# Altium project RP2040DualVision.PrjPcb
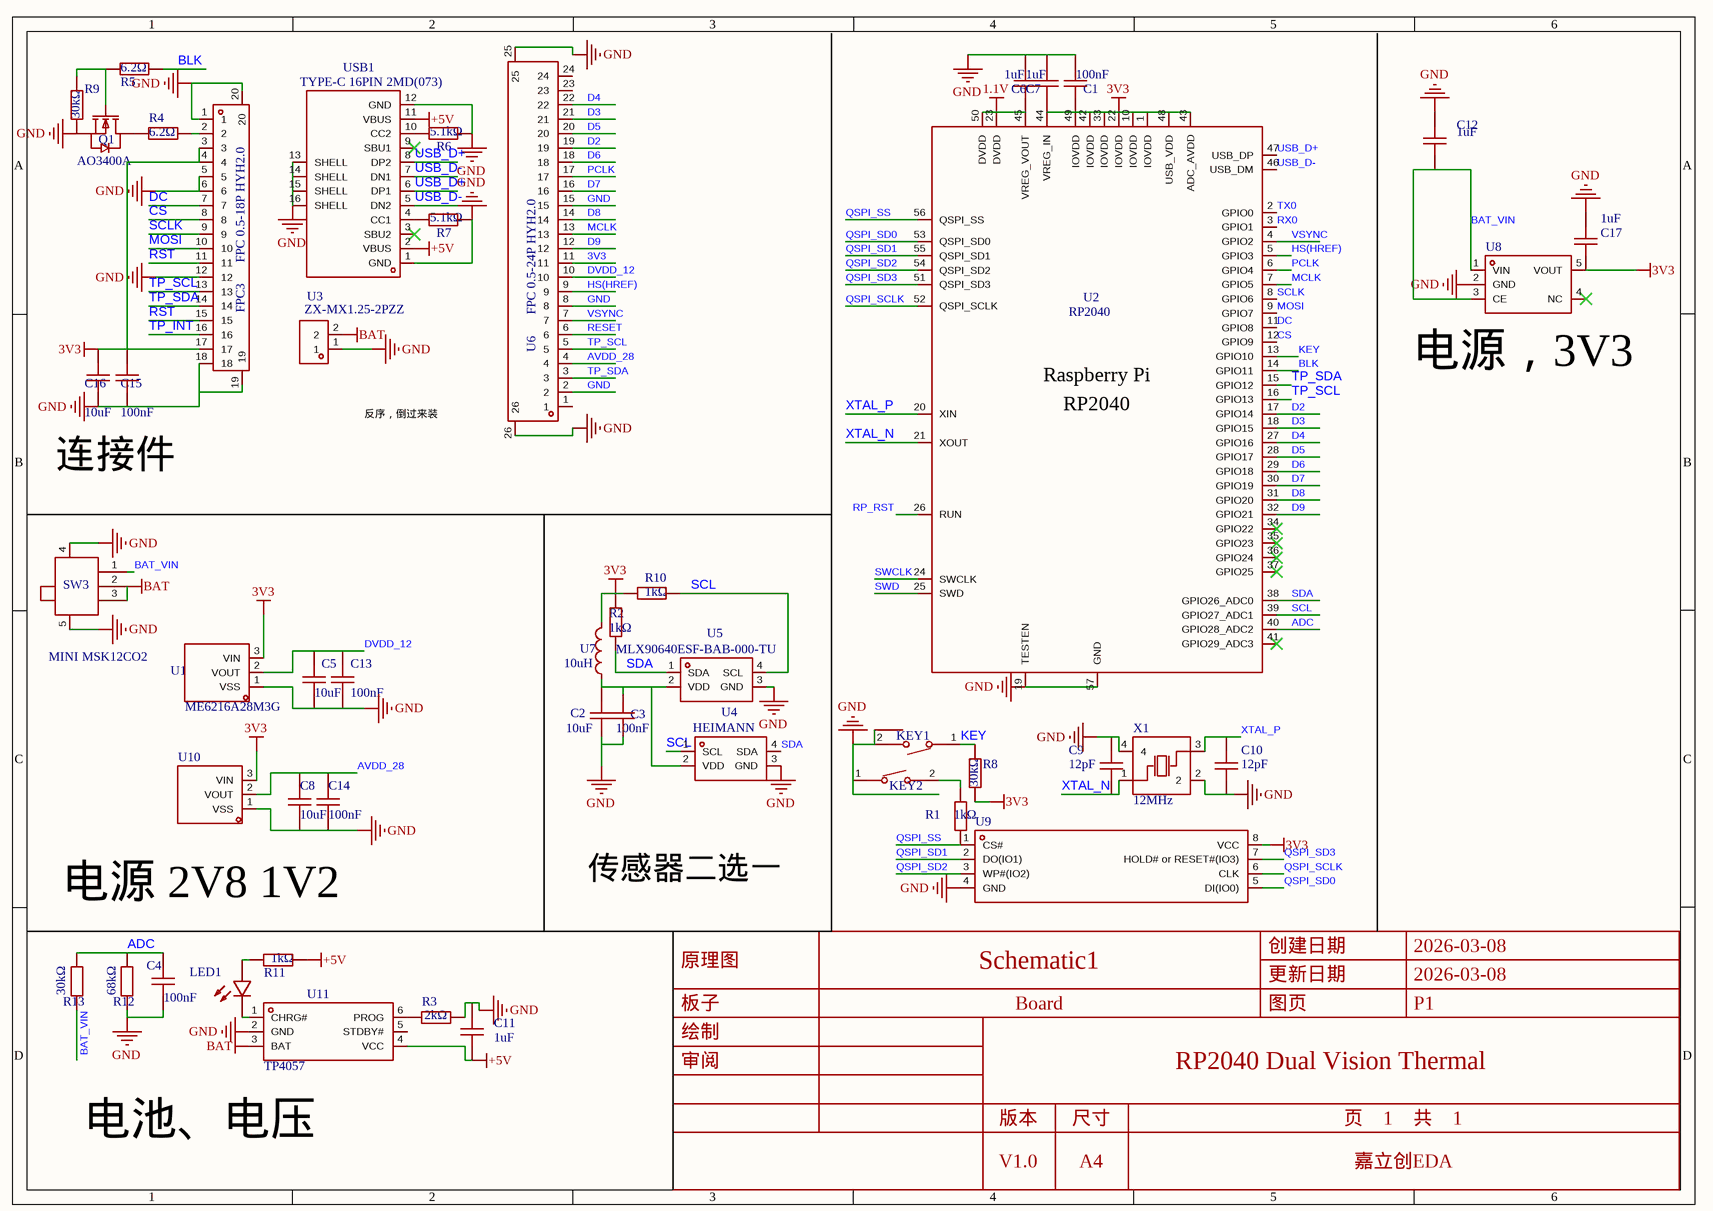
[diagram p0: P1.schdoc]
1 sheet, 49 parts. Net scope: global (net labels, ports and power ports of the same name join across sheets).
Board file: PCB1.pcbdoc

## Sheet P1.schdoc
size 297 x 209 mm; Symbol: Drawing-Symbol_A4; Company: 嘉立创EDA; Version: V1.0; Page Size: A4; @Project Name: RP2040 Dual Vision Thermal; @Page Count: 1; @Update Date: 2026-03-08; @Create Date: 2026-03-08; @Schematic Name: Schematic1; @Page No: 1; @Page Name: P1; @Create Time: 19:50:53; @Update Time: 19:51:13; Border: 1; Width: 1170; Height: 825; Region Start: 1; X Region Count: 6; Y Region Count: 4; Blade Width: 10; Title Block Position: 3; @Board Name: Board; Device: Drawing-Symbol_A4

### Parts
C1  100nF  [C0402]
C2  10uF  [C0402]
C3  100nF  [C0402]
C4  100nF  [C0402]
C5  10uF  [C0402]
C6  1uF  [C0402]
C7  1uF  [C0402]
C8  10uF  [C0402]
C9  12pF  [C0402]
C10  12pF  [C0402]
C11  1uF  [C0603]
C12  1uF  [C0402]
C13  100nF  [C0402]
C14  100nF  [C0402]
C15  100nF  [C0603]
C16  10uF  [C0603]
C17  1uF  [C0402]
FPC3  FPC 0.5-18P HYH2.0  [FPC-SMD_18P-P0.50_FPC-0.5-18P-HYH2.0]
KEY1  1TS003B-2500-3500A-CT  [KEY-SMD_1TS003B-2500-3500A-CT]  (value not drawn)
KEY2  1TS003B-2500-3500A-CT  [KEY-SMD_1TS003B-2500-3500A-CT]  (value not drawn)
LED1  NCD0603G1  [LED0603-RD_1]  (value not drawn)
Q1  AO3400A  [SOT-23-3_L2.9-W1.3-P1.90-LS2.4-BR]
R1  1kΩ  [R0603]
R2  1kΩ  [R0402]
R3  2kΩ  [R0603]
R4  6.2Ω  [R0603]
R5  6.2Ω  [R0603]
R6  5.1kΩ  [R0603]
R7  5.1kΩ  [R0603]
R8  30kΩ  [R0603]
R9  30kΩ  [R0603]
R10  1kΩ  [R0402]
R11  1kΩ  [R0603]
R12  68kΩ  [R0402]
R13  30kΩ  [R0402]
SW3  MINI MSK12CO2  [SW-SMD_MSK12CO2]
U1  ME6216A28M3G  [SOT-23-3_L2.9-W1.3-P1.90-LS2.4-BR]
U2  RP2040  [LQFN-56_L7.0-W7.0-P0.4-EP]
U3  ZX-MX1.25-2PZZ  [CONN-TH_2P-P1.25_MEGASTAR_ZX-MX1.25-2PZZ]
U4  HEIMANN  [TO-39-4_MELEXIS_MLX90640]
U5  MLX90640ESF-BAB-000-TU  [TO-39-4_MELEXIS_MLX90640]
U6  FPC 0.5-24P HYH2.0  [FPC-SMD_24P-P0.50_FPC-0.5-24P-HYH2.0]
U7  10uH  [IND-SMD_L2.0-W1.6-1]
U8  RT9013-33GB-MS  [SOT-23-5_L2.9-W1.6-P0.95-LS2.8-BR]  (value not drawn)
U9  W25Q32JVSSIQ  [SOIC-8_L5.3-W5.3-P1.27-LS8.0-BL]  (value not drawn)
U10  ME6216A12M3G  [SOT-23-3_L2.9-W1.6-P1.90-LS2.8-BR]  (value not drawn)
U11  TP4057  [SOT-23-6_L2.9-W1.6-P0.95-LS2.8-BR]
USB1  TYPE-C 16PIN 2MD(073)  [USB-C-SMD_TYPE-C-6PIN-2MD-073]
X1  12MHz  [OSC-SMD_4P-L2.5-W2.0-BL]

### Nets
1.1V: C6.1 U2.23(DVDD) U2.45(VREG_VOUT) U2.50(DVDD)
3V3: C1.1 C7.1 C15.2 C16.1 C17.1 FPC3.3 FPC3.4 FPC3.17 R2.2 R8.1 R10.2 U1.3(VIN) U2.1(IOVDD) U2.10(IOVDD) U2.22(IOVDD) U2.33(IOVDD) U2.42(IOVDD) U2.43(ADC_AVDD) U2.44(VREG_IN) U2.48(USB_VDD) U2.49(IOVDD) U6.11 U7.2 U8.5(VOUT) U9.8(VCC) U10.3(VIN)
+5V: C11.1 R11.1 U11.4(VCC) USB1.2(VBUS) USB1.11(VBUS)
BAT: SW3.2 SW3.3 U3.2 U11.3(BAT)
GND: C1.2 C2.1 C3.1 C4.1 C5.2 C6.2 C7.2 C8.2 C9.1 C10.2 C11.2 C12.2 C13.2 C14.2 C15.1 C16.2 C17.2 FPC3.1 FPC3.5 FPC3.6 FPC3.12 FPC3.18 FPC3.19 FPC3.20 KEY1.0 KEY1.2 KEY2.0 KEY2.1 Q1.2(S) R3.1 R6.1 R7.2 R9.2 R12.1 SW3.4 SW3.5 U1.1(VSS) U2.19(TESTEN) U2.57(GND) U3.1 U4.3(GND) U5.3(GND) U6.2 U6.8 U6.15 U6.25 U6.26 U8.2(GND) U9.4(GND) U10.1(VSS) U11.2(GND) USB1.1(GND) USB1.12(GND) USB1.13(SHELL) USB1.14(SHELL) USB1.15(SHELL) USB1.16(SHELL) X1.2 X1.4
ADC: C4.2 R12.2 R13.2 U2.40(GPIO28_ADC2)
AVDD_28: C8.1 C14.1 U6.4 U10.2(VOUT)
BAT_VIN: C12.1 R13.1 SW3.1 U8.1(VIN) U8.3(CE)
BLK: R5.2 U2.14(GPIO11)
CS: FPC3.8 U2.12(GPIO9)
D2: U2.17(GPIO14) U6.19
D3: U2.18(GPIO15) U6.21
D4: U2.27(GPIO16) U6.22
D5: U2.28(GPIO17) U6.20
D6: U2.29(GPIO18) U6.18
D7: U2.30(GPIO19) U6.16
D8: U2.31(GPIO20) U6.14
D9: U2.32(GPIO21) U6.12
DC: FPC3.7 U2.11(GPIO8)
DVDD_12: C5.1 C13.1 U1.2(VOUT) U6.10
HS(HREF): U2.5(GPIO3) U6.9
KEY: KEY1.1 R8.2 U2.13(GPIO10)
MCLK: U2.7(GPIO5) U6.13
MOSI: FPC3.10 U2.9(GPIO7)
PCLK: U2.6(GPIO4) U6.17
QSPI_SCLK: U2.52(QSPI_SCLK) U9.6(CLK)
QSPI_SD0: U2.53(QSPI_SD0) U9.5(DI(IO0))
QSPI_SD1: U2.55(QSPI_SD1) U9.2(DO(IO1))
QSPI_SD2: U2.54(QSPI_SD2) U9.3(WP#(IO2))
QSPI_SD3: U2.51(QSPI_SD3) U9.7(HOLD#_or_RESET#(IO3))
QSPI_SS: R1.1 U2.56(QSPI_SS) U9.1(CS#)
RESET: U6.6
RP_RST: U2.26(RUN)
RST: FPC3.11 FPC3.15
RX0: U2.3(GPIO1)
SCL: R10.1 U2.39(GPIO27_ADC1) U4.1(SCL) U5.4(SCL)
SCLK: FPC3.9 U2.8(GPIO6)
SDA: R2.1 U2.38(GPIO26_ADC0) U4.4(SDA) U5.1(SDA)
SWCLK: U2.24(SWCLK)
SWD: U2.25(SWD)
TP_INT: FPC3.16
TP_SCL: FPC3.13 U2.16(GPIO13) U6.5
TP_SDA: FPC3.14 U2.15(GPIO12) U6.3
TX0: U2.2(GPIO0)
USB_D+: U2.47(USB_DP) USB1.6(DP1) USB1.8(DP2)
USB_D-: U2.46(USB_DM) USB1.5(DN2) USB1.7(DN1)
VSYNC: U2.4(GPIO2) U6.7
XTAL_N: C9.2 U2.21(XOUT) X1.1(OSC1)
XTAL_P: C10.1 U2.20(XIN) X1.3(OSC2)
NetC2_2: C2.2 C3.2 U4.2(VDD) U5.2(VDD) U7.1
NetFPC3_2: FPC3.2 R4.1
NetKEY2_2: KEY2.2 R1.2
NetLED1_1: LED1.1(K) U11.1(CHRG#)
NetLED1_2: LED1.2(A) R11.2
NetQ1_1: Q1.1(G) R5.1 R9.1
NetQ1_3: Q1.3(D) R4.2
NetR3_2: R3.2 U11.6(PROG)
NetR6_2: R6.2 USB1.10(CC2)
NetR7_1: R7.1 USB1.4(CC1)

Not connected (* = marked no-connect by the designer): U2 34(GPIO22)* 35(GPIO23)* 36(GPIO24)* 37(GPIO25)* 41(GPIO29_ADC3)*; U6 1 23 24; U8 4(NC)*; U11 5(STDBY#); USB1 3(SBU2)* 9(SBU1)*

### Notes on the sheet
- (near U8) 电源，3V3
- 反序，倒过来装
- 连接件
- 电源 2V8 1V2
- 传感器二选一
- 电池、电压
- 创建日期
- 2026-03-08
- 原理图
- 板子
- Schematic1
- Board
- 更新日期
- 图页
- P1
- 绘制
- 审阅
- RP2040 Dual Vision Thermal
- 版本
- V1.0
- 尺寸
- A4
- 页    1    共    1
- 嘉立创EDA
- (in symbol RP2040_C2040) Raspberry Pi

### Library data of the parts
C1 C3 C4 C14 C15 = CGA0603X7R104K500JT: 容值:100nF;精度:±10%;额定电压:50V;温度系数:X7R;; Manufacturer: HRE(芯声); Convert to PCB: yes; ModelId: ac125912035d415993ca9572d50418b1; ModelName: C0603_L1.6-W0.8-H0.8; ModelTransform: 62.992,31.496,0,0,0,0,0,0,0; Tolerance: ±10%; Voltage Rating: 50V; Temperature Coefficient: X7R; Device: CGA0603X7R104K500JT; Symbol: CGA0603X7R104K500JT; Supplier Part: C6119867; Supplier: LCSC; Manufacturer Part: CGA0603X7R104K500JT; Add into BOM: yes; LCSC Part Name: 100nF ±10% 50V; Supplier Footprint: 0603; JLCPCB Part Class: Extended Part; Datasheet: https://atta.szlcsc.com/upload/public/pdf/source/20250103/C44077DA9E7B3EFAE02F22B6D3D1CBC9.pdf; Value: 100nF
  C1 C3 C4 C14: FootprintName: C0402
  C15: FootprintName: C0603
C2 C8 C16 = CGA0603X5R106K100JT: 容值:10uF;精度:±10%;额定电压:10V;温度系数:X5R;; Manufacturer: HRE(芯声); Convert to PCB: yes; ModelId: ac125912035d415993ca9572d50418b1; ModelName: C0603_L1.6-W0.8-H0.8; ModelTransform: 62.992,31.496,0,0,0,0,0,0,0; Tolerance: ±10%; Voltage Rating: 10V; Temperature Coefficient: X5R; Device: CGA0603X5R106K100JT; Symbol: CGA0603X5R106K100JT; Supplier: LCSC; Supplier Part: C6119842; Manufacturer Part: CGA0603X5R106K100JT; Add into BOM: yes; LCSC Part Name: 10uF ±10% 10V; Supplier Footprint: 0603; JLCPCB Part Class: Extended Part; Value: 10uF
  C2 C8: FootprintName: C0402
  C16: FootprintName: C0603
C5 = CGA0603X5R106K100JT: 容值:10uF;精度:±10%;额定电压:10V;温度系数:X5R;; Manufacturer: HRE(芯声); Convert to PCB: yes; 3D Model: ac125912035d415993ca9572d50418b1; 3D Model Transform: 62.992,31.496,0,0,0,0,0,0,0; Tolerance: ±10%; Voltage Rating: 10V; Temperature Coefficient: X5R; ModelName: C0603_L1.6-W0.8-H0.8; Device: CGA0603X5R106K100JT; Symbol: CGA0603X5R106K100JT; Supplier: LCSC; Supplier Part: C6119842; Manufacturer Part: CGA0603X5R106K100JT; Add into BOM: yes; LCSC Part Name: 10uF ±10% 10V; Supplier Footprint: 0603; JLCPCB Part Class: Extended Part; Value: 10uF; FootprintName: C0402
C6 C7 C11 = CGA0603X5R105K500JT: 容值:1uF;精度:±10%;额定电压:50V;温度系数:X5R;; Manufacturer: HRE(芯声); Convert to PCB: yes; ModelId: ac125912035d415993ca9572d50418b1; ModelName: C0603_L1.6-W0.8-H0.8; ModelTransform: 62.992,31.496,0,0,0,0,0,0,0; Tolerance: ±10%; Voltage Rating: 50V; Temperature Coefficient: X5R; Device: CGA0603X5R105K500JT; Symbol: CGA0603X5R105K500JT; Supplier Part: C6119852; Supplier: LCSC; Manufacturer Part: CGA0603X5R105K500JT; Add into BOM: yes; LCSC Part Name: 1uF ±10% 50V; Supplier Footprint: 0603; JLCPCB Part Class: Extended Part; Value: 1uF
  C6 C7: FootprintName: C0402
  C11: FootprintName: C0603
C9 C10 = 0603CG120F500NT: 容值:12pF;精度:±1%;额定电压:50V;材质(温度系数):C0G;; Manufacturer: FH(风华); Convert to PCB: yes; ModelId: ac125912035d415993ca9572d50418b1; ModelName: C0603_L1.6-W0.8-H0.8; ModelTransform: 62.992,31.496,0,0,0,0,0,0,0; Tolerance: ±1%; Voltage Rated: 50V; Temperature Coefficient: C0G; Device: 0603CG120F500NT; Symbol: 0603CG120F500NT; Supplier: LCSC; Supplier Part: C182482; Manufacturer Part: 0603CG120F500NT; Add into BOM: yes; LCSC Part Name: 12pF ±1% 50V; Supplier Footprint: 0603; JLCPCB Part Class: Extended Part; Datasheet: https://atta.szlcsc.com/upload/public/pdf/source/20200305/C486355_26A10D38EF8C2A5C37091D0039909270.pdf; FootprintName: C0402; Value: 12pF
C12 C17 = CGA0603X5R105K500JT: 容值:1uF;精度:±10%;额定电压:50V;温度系数:X5R;; Manufacturer: HRE(芯声); Add into BOM: yes; 3D Model: ac125912035d415993ca9572d50418b1; 3D Model Transform: 62.992,31.496,0,0,0,0,0,0,0; Tolerance: ±10%; Voltage Rating: 50V; Temperature Coefficient: X5R; ModelName: C0603_L1.6-W0.8-H0.8; Symbol: CGA0603X5R105K500JT; Device: CGA0603X5R105K500JT; Convert to PCB: yes; Supplier Part: C6119852; Supplier: LCSC; Manufacturer Part: CGA0603X5R105K500JT; LCSC Part Name: 1uF ±10% 50V; Supplier Footprint: 0603; JLCPCB Part Class: Extended Part; Value: 1uF; FootprintName: C0402
C13 = CGA0603X7R104K500JT: 容值:100nF;精度:±10%;额定电压:50V;温度系数:X7R;; Manufacturer: HRE(芯声); Convert to PCB: yes; 3D Model: ac125912035d415993ca9572d50418b1; 3D Model Transform: 62.992,31.496,0,0,0,0,0,0,0; Tolerance: ±10%; Voltage Rating: 50V; Temperature Coefficient: X7R; ModelName: C0603_L1.6-W0.8-H0.8; Device: CGA0603X7R104K500JT; Symbol: CGA0603X7R104K500JT; Supplier: LCSC; Supplier Part: C6119867; Manufacturer Part: CGA0603X7R104K500JT; Add into BOM: yes; LCSC Part Name: 100nF ±10% 50V; Supplier Footprint: 0603; JLCPCB Part Class: Extended Part; Datasheet: https://atta.szlcsc.com/upload/public/pdf/source/20250103/C44077DA9E7B3EFAE02F22B6D3D1CBC9.pdf; Value: 100nF; FootprintName: C0402
FPC3 = FPC 0.5-18P HYH2.0: 锁定特性:翻盖式;触点类型:双侧触点/上下接;触点数量:18P;间距:0.5mm;安装类型:卧贴;工作温度范围:-25℃~+85℃;; Manufacturer: SHOU HAN(首韩); Symbol: 0.5K-HX-18PWB; Convert to PCB: yes; ModelId: c307a3740b784ab2974115b74c22844b; ModelTransform: 482.676,212.598,0,0,0,0,0,-33.465,0; Locking Feature: 翻盖式; Number of Contacts: 18P; Pitch: 0.5mm; Device: FPC 0.5-18P HYH2.0; Supplier: LCSC; Supplier Part: C6364663; Manufacturer Part: FPC 0.5-18P HYH2.0; Add into BOM: yes; LCSC Part Name: 翻盖式 双侧触点/上下接 P数:18P 间距:0.5mm; Supplier Footprint: SMD,P=0.5mm,卧贴; JLCPCB Part Class: Extended Part; Datasheet: https://atta.szlcsc.com/upload/public/pdf/source/20230523/62F572C84183A3F56D4E397A51200C96.pdf; FootprintName: FPC-SMD_18P-P0.50_FPC-0.5-18P-HYH2.0; ModelName: FPC-SMD_18P-P0.50_FPC-0.5-18P-HYH2.0; Contact Type: 双侧触点/上下接; Mounting Type: 卧贴; Height Above Board: 2mm; Contact Material: 铜; Contact Plating: 锡; Operating Temperature Range: -25℃~+85℃
KEY1 KEY2 = 1TS003B-2500-3500A-CT: 电路结构:单刀单掷;按钮形状:矩形按钮;作用力:250gf;安装方式:卧贴;开关长度:4.6mm;开关宽度:1.82mm;开关高度:3.5mm;带支架:不带;触点电流:50mA;额定电压(DC):12V;额定功率:0.6W;绝缘电阻:100MΩ;带灯:无;机械寿命:1.5万次;; Manufacturer: HYP(鸿源精密); Convert to PCB: yes; ModelId: d59c0297adac4306a1d4ba4f2a7de8bf; ModelName: KEY-SMD_L4.6-W2.3-H1.8-P3.4; ModelTransform: 181.102,139.7635,0,0,0,0,-0.005,-28.621,-19.685; Circuit: 单刀单掷; Actuator Style: 矩形按钮; Operating Force: 250gf; Switch Length: 4.6mm; Switch Width: 1.82mm; Switch Height: 3.5mm; Strike Gundam: 不带; Contact Current: 50mA; Voltage Rating (DC): 12V; Power Rating: 0.6W; Insulation Resistance: 100MΩ; Actuator/Cap Color: 黑色; With Lamp: 无; Pin Style: J型引脚; Mechanical Life: 1.5万次; Device: 1TS003B-2500-3500A-CT; Symbol: 1TS003B-2500-3500A; Supplier: LCSC; Supplier Part: C255810; Manufacturer Part: 1TS003B-2500-3500A-CT; Add into BOM: yes; LCSC Part Name: 4.6*1.82*3.5mm 卧贴 轻触开关; Supplier Footprint: SMD,2x4mm; JLCPCB Part Class: Extended Part; Datasheet: https://atta.szlcsc.com/upload/public/pdf/source/20180720/C255810_F77B30B42331AEA91D48A1AA0FBA2945.pdf; FootprintName: KEY-SMD_1TS003B-2500-3500A-CT; Mounting Style: 卧贴; Operating Temperature: -40℃~+90℃
LED1 = NCD0603G1: 发光颜色:翠绿色;正向压降(Vf):2.6V~3.6V;功率:72mW;正向电流:20mA;波长:515nm~530nm;透镜颜色:-;发光强度:330mcd~900mcd;发光角度:130°;工作温度:-30℃~+85℃;; Manufacturer: 国星光电; Symbol: FC-D1608UGK-520D10; Convert to PCB: yes; ModelId: 3beb0148d24d477aac1d9f7d4b6d534c; ModelTransform: 62.2046,31.496,0,0,0,0,-1.948,0.215,0; Illumination Color: 翠绿色; Power(Watts): 72mW; Forward Current: 20mA; Viewing Angle: 130°; Device: NCD0603G1; Supplier: LCSC; Manufacturer Part: NCD0603G1; Supplier Part: C84267; Add into BOM: yes; LCSC Part Name: NCD0603G1; Supplier Footprint: 0603; JLCPCB Part Class: Extended Part; Datasheet: https://item.szlcsc.com/datasheet/NCD0603G1/85436.html; FootprintName: LED0603-RD_1; ModelName: LED0603-RD_1; Voltage - Forward(Vf): 2.6V~3.6V; Wavelength - Dominant: 515nm~530nm; Lens Color: -; Luminous Intensity: 330mcd~900mcd; Operating Temperature: -30℃~+85℃
Q1 = AO3400A_C347475: 类型:1个N沟道;漏源电压(Vdss):30V;连续漏极电流(Id):5.8A;导通电阻(RDS(on)@Vgs,Id):28mΩ@10V,5.8A;功率(Pd):1.4W;阈值电压(Vgs(th)@Id):1.4V@250uA;; Manufacturer: UMW(友台半导体); Convert to PCB: yes; ModelId: c62791f0466c4ae2a892c056b845b0ca; ModelName: SOT-23-3P_L2.9-W1.3-H1.0-LS2.4-P0.95; ModelTransform: 98.425,114.173,0,180,0,0,0.0005,-0.0005,0; Type: 1个N沟道; Drain Source Voltage (Vdss): 30V; Power Dissipation (Pd): 1.4W; Total Gate Charge (Qg@Vgs): 12nC@10V; Input Capacitance (Ciss@Vds): 1.05nF@24V; Reverse Transfer Capacitance (Crss@Vds): 77pF@15V; Device: AO3400A_C347475; Symbol: AO3400A_C347475; Supplier: LCSC; Supplier Part: C347475; Manufacturer Part: AO3400A; JLCPCB Part Class: Extended Part; Add into BOM: yes; LCSC Part Name: 1个N沟道 耐压:30V 电流:5.8A; Supplier Footprint: SOT-23; Datasheet: https://atta.szlcsc.com/upload/public/pdf/source/20231109/50AB4FB4D66E55864F9B8D027B723C9A.pdf; FootprintName: SOT-23-3_L2.9-W1.3-P1.90-LS2.4-BR; Continuous Drain Current (Id): 5.8A; Drain Source On Resistance (RDS(on)@Vgs,Id): 28mΩ@10V,5.8A; Gate Threshold Voltage (Vgs(th)@Id): 1.4V@250uA; Operating Temperature: -55℃~+150℃
R1 R11 = 0603WAF1001T5E: 电阻类型:厚膜电阻;阻值:1kΩ;精度:±1%;功率:100mW;最大工作电压:75V;温度系数:±100ppm/℃;; Manufacturer: UNI-ROYAL(厚声); Convert to PCB: yes; ModelId: fc143cca1e79419f9cd78b61e9279f08; ModelTransform: 31.8897,63.7794,0,90,0,0,0,0,0; Tolerance: ±1%; Power(Watts): 100mW; Overload Voltage (Max): 75V; Device: 0603WAF1001T5E; Symbol: 0603WAF1001T5E; Supplier Part: C21190; Supplier: LCSC; Manufacturer Part: 0603WAF1001T5E; Add into BOM: yes; LCSC Part Name: 1kΩ ±1% 100mW 厚膜电阻; Supplier Footprint: 0603; JLCPCB Part Class: 基础库; Datasheet: https://atta.szlcsc.com/upload/public/pdf/source/20200306/C422600_1E6D84923E4A46A82E41ADD87F860B5C.pdf; FootprintName: R0603; ModelName: R0603; Type: 厚膜电阻; Value: 1kΩ; Temperature Coefficient: ±100ppm/℃; Operating Temperature Range: -55℃~+155℃
R2 R10 = 0603WAF1001T5E: 电阻类型:厚膜电阻;阻值:1kΩ;精度:±1%;功率:100mW;最大工作电压:75V;温度系数:±100ppm/℃;; Manufacturer: UNI-ROYAL(厚声); Convert to PCB: yes; ModelId: fc143cca1e79419f9cd78b61e9279f08; ModelName: R0603; ModelTransform: 31.8897,63.7794,0,90,0,0,0,0,0; Tolerance: ±1%; Power(Watts): 100mW; Overload Voltage (Max): 75V; Device: 0603WAF1001T5E; Symbol: 0603WAF1001T5E; Supplier: LCSC; Supplier Part: C21190; Manufacturer Part: 0603WAF1001T5E; Add into BOM: yes; LCSC Part Name: 1kΩ ±1% 100mW 厚膜电阻; Supplier Footprint: 0603; JLCPCB Part Class: 基础库; Datasheet: https://atta.szlcsc.com/upload/public/pdf/source/20200306/C422600_1E6D84923E4A46A82E41ADD87F860B5C.pdf; FootprintName: R0402; Type: 厚膜电阻; Value: 1kΩ; Temperature Coefficient: ±100ppm/℃; Operating Temperature Range: -55℃~+155℃
R3 = 0603WAF2001T5E: 电阻类型:厚膜电阻;阻值:2kΩ;精度:±1%;功率:100mW;工作电压:75V;温度系数:±100ppm/℃;; Manufacturer: UNI-ROYAL(厚声); nameAlias: Resistance (Ohms); Contributor: dhx233; Convert to PCB: yes; ModelId: fc143cca1e79419f9cd78b61e9279f08; ModelTransform: 31.8897,63.7794,0,90,0,0,0,0,0; Tolerance: ±1%; Power(Watts): 100mW; Voltage-Supply(Max): 75V; Origin Footprint: R0603; Device: 0603WAF2001T5E; Symbol: 0603WAF2001T5E; Supplier: LCSC; Supplier Part: C22975; Manufacturer Part: 0603WAF2001T5E; spicePre: R; spiceSymbolName: res-0603; Add into BOM: yes; LCSC Part Name: 2kΩ ±1% 100mW 厚膜电阻; Supplier Footprint: 0603; JLCPCB Part Class: Basic Part; Datasheet: https://atta.szlcsc.com/upload/public/pdf/source/20200306/C422600_1E6D84923E4A46A82E41ADD87F860B5C.pdf; FootprintName: R0603; ModelName: R0603; Type: 厚膜电阻; Value: 2kΩ; Temperature Coefficient: ±100ppm/℃; Operating Temperature: -55℃~+155℃
R4 R5 = 0603WAF6201T5E: 电阻类型:厚膜电阻;阻值:6.2kΩ;精度:±1%;功率:100mW;工作电压:75V;温度系数:±100ppm/℃;; Manufacturer: UNI-ROYAL(厚声); Convert to PCB: yes; ModelId: fc143cca1e79419f9cd78b61e9279f08; ModelTransform: 31.8897,63.7794,0,90,0,0,0,0,0; Tolerance: ±1%; Power(Watts): 100mW; Voltage-Supply(Max): 75V; Value: 6.2Ω; Device: 0603WAF6201T5E; Symbol: 0603WAF6201T5E; Supplier: LCSC; Manufacturer Part: 0603WAF6201T5E; Add into BOM: yes; LCSC Part Name: 6.2kΩ ±1% 100mW 厚膜电阻; Supplier Footprint: 0603; JLCPCB Part Class: Basic Part; Datasheet: https://item.szlcsc.com/datasheet/0603WAF6201T5E/4667.html; FootprintName: R0603; ModelName: R0603; Type: 厚膜电阻; Temperature Coefficient: ±100ppm/℃; Operating Temperature: -55℃~+155℃
R6 R7 = 0603WAF5101T5E: 电阻类型:厚膜电阻;阻值:5.1kΩ;精度:±1%;功率:100mW;工作电压:75V;温度系数:±100ppm/℃;; Manufacturer: UNI-ROYAL(厚声); Convert to PCB: yes; ModelId: fc143cca1e79419f9cd78b61e9279f08; ModelTransform: 31.8897,63.7794,0,90,0,0,0,0,0; Tolerance: ±1%; Power(Watts): 100mW; Voltage-Supply(Max): 75V; Device: 0603WAF5101T5E; Symbol: 0603WAF5101T5E; Supplier: LCSC; Supplier Part: C23186; Manufacturer Part: 0603WAF5101T5E; Add into BOM: yes; LCSC Part Name: 5.1kΩ ±1% 100mW 厚膜电阻; Supplier Footprint: 0603; JLCPCB Part Class: Basic Part; Datasheet: https://atta.szlcsc.com/upload/public/pdf/source/20200306/C422600_1E6D84923E4A46A82E41ADD87F860B5C.pdf; FootprintName: R0603; ModelName: R0603; Type: 厚膜电阻; Value: 5.1kΩ; Temperature Coefficient: ±100ppm/℃; Operating Temperature: -55℃~+155℃
R8 R9 = 0603WAF3002T5E: 电阻类型:厚膜电阻;阻值:30kΩ;精度:±1%;功率:100mW;最大工作电压:75V;温度系数:±100ppm/℃;; Manufacturer: UNI-ROYAL(厚声); Convert to PCB: yes; ModelId: fc143cca1e79419f9cd78b61e9279f08; ModelTransform: 31.8897,63.7794,0,90,0,0,0,0,0; Tolerance: ±1%; Power(Watts): 100mW; Overload Voltage (Max): 75V; Device: 0603WAF3002T5E; Symbol: 0603WAF3002T5E; Supplier: LCSC; Supplier Part: C22984; Manufacturer Part: 0603WAF3002T5E; Add into BOM: yes; LCSC Part Name: 30kΩ ±1% 100mW 厚膜电阻; Supplier Footprint: 0603; JLCPCB Part Class: Basic Part; Datasheet: https://atta.szlcsc.com/upload/public/pdf/source/20200306/C422600_1E6D84923E4A46A82E41ADD87F860B5C.pdf; FootprintName: R0603; ModelName: R0603; Type: 厚膜电阻; Value: 30kΩ; Temperature Coefficient: ±100ppm/℃; Operating Temperature Range: -55℃~+155℃
R12 = 0603WAF6802T5E: 电阻类型:厚膜电阻;阻值:68kΩ;精度:±1%;功率:100mW;工作电压:75V;温度系数:±100ppm/℃;; Manufacturer: UNI-ROYAL(厚声); Symbol: 0603WAF6803T5E; Convert to PCB: yes; ModelId: fc143cca1e79419f9cd78b61e9279f08; ModelName: R0603; ModelTransform: 31.8897,63.7794,0,90,0,0,0,0,0; Tolerance: ±1%; Power(Watts): 100mW; Voltage-Supply(Max): 75V; Device: 0603WAF6802T5E; Supplier: LCSC; Supplier Part: C23231; Manufacturer Part: 0603WAF6802T5E; Add into BOM: yes; LCSC Part Name: 68kΩ ±1% 100mW 厚膜电阻; Supplier Footprint: 0603; JLCPCB Part Class: Basic Part; Datasheet: https://item.szlcsc.com/datasheet/0603WAF6802T5E/23958.html; FootprintName: R0402; Type: 厚膜电阻; Value: 68kΩ; Temperature Coefficient: ±100ppm/℃; Operating Temperature: -55℃~+155℃
R13 = 0603WAF3002T5E: 电阻类型:厚膜电阻;阻值:30kΩ;精度:±1%;功率:100mW;工作电压:75V;温度系数:±100ppm/℃;; Manufacturer: UNI-ROYAL(厚声); Symbol: 0603WAF3003T5E; Convert to PCB: yes; Voltage-Supply(Max): 75V; ModelId: fc143cca1e79419f9cd78b61e9279f08; ModelName: R0603; ModelTransform: 31.8897,63.7794,0,90,0,0,0,0,0; Tolerance: ±1%; Power(Watts): 100mW; Datasheet: https://item.szlcsc.com/datasheet/0603WAF3002T5E/23711.html; Device: 0603WAF3002T5E; Supplier: LCSC; Supplier Part: C22984; Manufacturer Part: 0603WAF3002T5E; Add into BOM: yes; Operating Temperature: -55℃~+155℃; LCSC Part Name: 30kΩ ±1% 100mW 厚膜电阻; Supplier Footprint: 0603; JLCPCB Part Class: Basic Part; FootprintName: R0402; Type: 厚膜电阻; Value: 30kΩ; Overload Voltage (Max): 75V; Temperature Coefficient: ±100ppm/℃; Operating Temperature Range: -55℃~+155℃
SW3 = MINI MSK12CO2: 电路结构:单刀双掷;安装方式:卧贴;开关颜色:-;额定电流(DC):50mA;额定电压(DC):12V;额定电流(AC):-;额定电压(AC):-;机械寿命:1万次;; Manufacturer: SHOU HAN(首韩); Convert to PCB: yes; ModelId: 117ad1edd5404399859fbaa8e94e3fc9; ModelTransform: 236.22,202.7555,0,0,0,0,0,-24.921,-19.685; Circuit: 单刀双掷; Pin Style: SMD接片; Switch Length: 5mm; Switch Width: 2.75mm; Switch Height: 1.4mm; Current Rating (DC): 50mA; Voltage Rating (DC): 12V; Mechanical Life: 1万次; Device: MINI MSK12CO2; Symbol: MINI MSK12CO2; Supplier: LCSC; Supplier Part: C2681570; Manufacturer Part: MINI MSK12CO2; JLCPCB Part Class: Extended Part; Add into BOM: yes; LCSC Part Name: 迷你七脚两档侧拨拨动 mini七7脚 微型拨动; Supplier Footprint: SMD; Datasheet: https://atta.szlcsc.com/upload/public/pdf/source/20210224/C2681570_D263F9C605E4588A4AE6114B72AE4C72.pdf; FootprintName: SW-SMD_MSK12CO2; ModelName: SW-SMD_MSK12CO2; Actuator Style: -; Mounting Style: 卧贴; Actuator Color: -; Current Rating (AC): -; Voltage Rating (AC): -; Operating Temperature: -16℃~+60℃
U1 = ME6216A28M3G: 输出类型:固定;工作电压:9V;输出电压:2.8V;输出电流:300mA;电源纹波抑制比(PSRR):65dB@(1kHz);输出极性:正极;; Manufacturer: MICRONE(南京微盟); AddInBom: yes; ModelId: c62791f0466c4ae2a892c056b845b0ca|0819f05c4eef4c71ace90d822a990e87; ModelName: SOT-23-3P_L2.9-W1.3-H1.0-LS2.4-P0.95; ModelTransform: 98.425,114.173,0,180,0,0,0.0005,-0.0005,0; Output Type: 固定; Voltage - Supply: 9V; Output Voltage: 2.8V; Output Current: 300mA; Voltage Dropout: 120mV@(100mA)；230mV@(200mA); standby current: 5uA; Output Configuration: 正极; Number of Outputs: 1; Symbol: ME6216A28M3G; Device: ME6216A28M3G; LCSC Part Name: 2.8V 300mA 9V; SupplierPart: C236658; ManufacturerPart: ME6216A28M3G; Supplier Footprint: SOT-23-3; JLCPCB Part Class: Extended Part; Datasheet: https://item.szlcsc.com/datasheet/ME6216A28M3G/236098.html; Supplier: LCSC; ConvertToPcb: yes; FootprintName: SOT-23-3_L2.9-W1.3-P1.90-LS2.4-BR; Power Supply Rejection Ratio (PSRR): 65dB@(1kHz); Features: 短路保护；过流保护; Operating Temperature: -25℃~+125℃@(Ta)
U2 = RP2040_C2040: CPU内核:-;CPU最大主频:133MHz;应用领域:-;; Manufacturer: Raspberry Pi(树莓派); Convert to PCB: yes; ModelId: 6aba77e112f94190bc358c1827f6a3d4; ModelTransform: 276.377,276.377,0,0,0,0,0,0,0; CPU Maximum Speed: 133MHz; Number of I/O: 30; ADC (Bit): 12bit; Device: RP2040_C2040; Symbol: RP2040; Supplier: LCSC; Supplier Part: C2040; Manufacturer Part: RP2040; JLCPCB Part Class: Extended Part; Add into BOM: yes; LCSC Part Name: RP2040（RP2B2）; Supplier Footprint: LQFN-56(7x7); Datasheet: https://atta.szlcsc.com/upload/public/pdf/source/20210621/C2040_96F425825606B7957D87DD32E2512CA9.pdf; FootprintName: LQFN-56_L7.0-W7.0-P0.4-EP; ModelName: LQFN-56_L7.0-W7.0-P0.4-EP; CPU Core: -; Applications: -
U3 = ZX-MX1.25-2PZZ: 插针结构:1x2P;间距:1.25mm;安装方式:直插;参考系列:PicoBlade(MX 1.25);总PIN数:2P;排数:1;每排PIN数:2;行距:-;额定电流:1A;触头材质:黄铜;触头镀层:锡;工作温度:-25℃~+85℃;; Manufacturer: Megastar(兆星); Origin Footprint: CONN-SMD_AFC10-S02QCA-00; Contributor: LCSC; Convert to PCB: yes; ModelId: e8102c00ed5947ba8ee52e2fe36dbac2; ModelTransform: 173.6217,129.921,0,0,0,0,-0.039,-15.748,-90.551; Pins Structure: 1x2P; Pitch: 1.25mm; Number of PINs Per Row: 2; Current Rating: 1A; Voltage Rating: 125V; Z-Height of the Board: 4.6mm; X-Length of Bottom Edge on Board (Spacing Line): 4.4mm; Y-Width of Bottom Edge on Board: 3.3mm; Device: ZX-MX1.25-2PZZ; Symbol: ZX-MX1.25-2PZZ; Supplier: LCSC; Supplier Part: C7430458; Manufacturer Part: ZX-MX1.25-2PZZ; JLCPCB Part Class: Extended Part; spicePre: X; spiceSymbolName: AFC10-S02QCA-00; Add into BOM: yes; LCSC Part Name: 1x2P 间距:1.25mm 直插 系列:PicoBlade(MX 1.25); Supplier Footprint: 插件,P=1.25mm; Datasheet: https://item.szlcsc.com/datasheet/ZX-MX1.25-2PZZ/8430327.html; FootprintName: CONN-TH_2P-P1.25_MEGASTAR_ZX-MX1.25-2PZZ; ModelName: CONN-TH_2P-P1.25_MEGASTAR_ZX-MX1.25-2PZZ; Mounting Type: 直插; Reference Series: PicoBlade(MX 1.25); Number of Pins: 2P; Number of Rows: 1; Row Spacing: -; Contact Material: 黄铜; Contact Plating: 锡; Operating Temperature: -25℃~+85℃; Plastic Material: -; Flame Retardant Rating: -; Supplementary Features: -; Color: 白色
U4 = HEIMANN: Contributor: lcsc; Convert to PCB: yes; ModelId: 91a5011a4f354d6ca21cd4c96abbb53a; Origin Footprint: TO-39-4_MELEXIS_MLX90640; Device: HEIMANN; Symbol: HEIMANN; spicePre: U; spiceSymbolName: MLX90640ESF-BAB-000-TU; Add into BOM: yes; FootprintName: TO-39-4_MELEXIS_MLX90640; ModelName: TO-39-4_MELEXIS_MLX90640
U5 = MLX90640ESF-BAB-000-TU: Contributor: lcsc; Convert to PCB: yes; ModelId: 91a5011a4f354d6ca21cd4c96abbb53a; Origin Footprint: TO-39-4_MELEXIS_MLX90640; Device: MLX90640ESF-BAB-000-TU; Symbol: MLX90640ESF-BAB-000-TU; spicePre: U; spiceSymbolName: MLX90640ESF-BAB-000-TU; Add into BOM: yes; FootprintName: TO-39-4_MELEXIS_MLX90640; ModelName: TO-39-4_MELEXIS_MLX90640
U6 = FPC 0.5-24P HYH2.0: 锁定特性:翻盖式;触点类型:双侧触点/上下接;触点数量:24P;间距:0.5mm;安装类型:卧贴;工作温度范围:-25℃~+85℃;; Manufacturer: SHOU HAN(首韩); AddInBom: yes; ModelId: 398e2e2b708944789e2b8f6cc2aac4b0; ModelTransform: 600.7862,212.598,0,0,0,0,-0.001,-33.465,0; Locking Feature: 翻盖式; Number of Contacts: 24P; Pitch: 0.5mm; Symbol: FPC 0.5-24P HYH2.0; Device: FPC 0.5-24P HYH2.0; LCSC Part Name: 翻盖式 双侧触点/上下接 P数:24P 间距:0.5mm; SupplierPart: C6364666; ManufacturerPart: FPC 0.5-24P HYH2.0; Supplier Footprint: SMD,P=0.5mm,卧贴; JLCPCB Part Class: Extended Part; Datasheet: https://atta.szlcsc.com/upload/public/pdf/source/20230523/0D0BE2E5451E3DED900F71B4B7504802.pdf; Supplier: LCSC; ConvertToPcb: yes; FootprintName: FPC-SMD_24P-P0.50_FPC-0.5-24P-HYH2.0; ModelName: FPC-SMD_24P-P0.50_FPC-0.5-24P-HYH2.0; Contact Type: 双侧触点/上下接; Mounting Type: 卧贴; Height Above Board: 2mm; Contact Material: 铜; Contact Plating: 锡; Operating Temperature Range: -25℃~+85℃
U7 = LQH2MPN100MGRL: 电感值:10uH;精度:±20%;额定电流:480mA;饱和电流(Isat):610mA;; Manufacturer: muRata(村田); Convert to PCB: yes; ModelId: e46c02e66e4b482b810d7eae4ef76c7b; ModelTransform: 78.74,62.992,0,0,0,0,0,-0.003,0; Tolerance: ±20%; Rated Current: 480mA; Saturation Current (Isat): 610mA; DC Resistance (DCR): 1.056Ω; Device: LQH2MPN100MGRL; Symbol: LQH2MPN100MGRL; Supplier: LCSC; Supplier Part: C703131; Manufacturer Part: LQH2MPN100MGRL; Add into BOM: yes; LCSC Part Name: 10uH ±20% 610mA; Supplier Footprint: 0806; JLCPCB Part Class: Extended Part; Datasheet: https://atta.szlcsc.com/upload/public/pdf/source/20191022/C440248_094C93E028FCF0FA66FA57BC1ADCD3EF.pdf; FootprintName: IND-SMD_L2.0-W1.6-1; ModelName: IND-SMD_L2.0-W1.6-1; Value: 10uH; Ratings: -
U8 = RT9013-33GB-MS: 输出类型:固定;最大输入电压:5.5V;输出电压:3.3V;最大输出电流:500mA;电源纹波抑制比(PSRR):75dB@(1kHz);输出极性:正极;; Manufacturer: MSKSEMI(美森科); AddInBom: yes; ModelId: 7ba65df16e7b4570af156e925f9c37fe|0819f05c4eef4c71ace90d822a990e87; ModelTransform: 114.173,114.173,0,90,0,0,0,0,0; Output Type: 固定; Maximum Input Voltage: 5.5V; Output Voltage: 3.3V; MAX Output Current: 500mA; Output Polarity: 正极; Symbol: RT9013-33GB-MS; Device: RT9013-33GB-MS; LCSC Part Name: RT9013-33GB-MS; SupplierPart: C7434207; ManufacturerPart: RT9013-33GB-MS; Supplier Footprint: SOT-23-5; JLCPCB Part Class: Extended Part; Datasheet: https://atta.szlcsc.com/upload/public/pdf/source/20230705/1D6536D82D93AC1E044F3DAE104751D9.pdf; Supplier: LCSC; ConvertToPcb: yes; FootprintName: SOT-23-5_L2.9-W1.6-P0.95-LS2.8-BR; ModelName: SOT-23-5_L2.9-W1.6-P0.95-LS2.8-BR; Power Supply Rejection Ratio (PSRR): 75dB@(1kHz)
U9 = W25Q32JVSSIQ: 接口类型:SPI;存储容量:32Mbit;时钟频率(fc):133MHz;; Manufacturer: Winbond(华邦); Symbol: W25Q32JVSSIQ_C179173; AddInBom: yes; ModelId: f83d990ad74f400caf5ac920b7771508|0819f05c4eef4c71ace90d822a990e87; ModelName: SOIC-8_L5.3-W5.3-H1.9-LS7.9-P1.27; ModelTransform: 208.661,311.25654,0,0,0,0,-0.0005,0.0005,0; Interface: SPI; Memory Size: 32Mbit; Clock Frequency: 133MHz; Voltage - Supply: 2.7V~3.6V; Standby Supply Current: 1uA; Program / Erase Cycles: 100000次; Page Programming Time (Tpp): 3ms; Data Retention - TDR (Year): 20年; Device: W25Q32JVSSIQ; LCSC Part Name: 支持双线、四线SPI接口的3V、32Mbit 串行SPI闪存; SupplierPart: C179173; ManufacturerPart: W25Q32JVSSIQ; Supplier Footprint: SOIC-8-208mil; JLCPCB Part Class: Extended Part; Datasheet: https://item.szlcsc.com/datasheet/W25Q32JVSSIQ/190567.html; Supplier: LCSC; ConvertToPcb: yes; FootprintName: SOIC-8_L5.3-W5.3-P1.27-LS8.0-BL; Block Erase Time(tBE): -; Operating Temperature: -40℃~+85℃
U10 = ME6216A12M3G: 输出类型:固定;工作电压:6V;输出电压:1.2V;输出电流:250mA;电源纹波抑制比(PSRR):65dB@(1kHz);输出极性:正极;; Manufacturer: MICRONE(南京微盟); AddInBom: yes; ModelId: 89cb27a44ab2466697082bb9fd73a7d0|0819f05c4eef4c71ace90d822a990e87; ModelName: SOT-23-3L_L2.9-W1.6-H1.1-LS2.8-P0.95; ModelTransform: 114.173,110.236,0,90,0,0,0,0,0; Output Type: 固定; Voltage - Supply: 6V; Output Voltage: 1.2V; Output Current: 250mA; Voltage Dropout: 600mV@(200mA); Output Configuration: 正极; Number of Outputs: 1; Symbol: ME6216A12M3G; Device: ME6216A12M3G; LCSC Part Name: 输入6V 输出1.2V 250mA; SupplierPart: C236663; ManufacturerPart: ME6216A12M3G; Supplier Footprint: SOT23-3; JLCPCB Part Class: Extended Part; Datasheet: https://item.szlcsc.com/datasheet/ME6216A12M3G/236103.html; Supplier: LCSC; ConvertToPcb: yes; FootprintName: SOT-23-3_L2.9-W1.6-P1.90-LS2.8-BR; Power Supply Rejection Ratio (PSRR): 65dB@(1kHz); standby current: -; Features: 短路保护；过流保护; Operating Temperature: -25℃~+125℃@(Ta)
U11 = TP4057: 工作电压:4V~6.5V;最大充电电流:-;电池类型:锂离子;电池节数:1;; Manufacturer: UMW(友台半导体); Symbol: TP4057_C725791; AddInBom: yes; ModelId: 18da8f6c14a34920b3e136b5c401a119; ModelName: SOT-23-6_L2.9-W1.6-H1.5-LS2.8-P0.95; ModelTransform: 110.73671,114.173,0,180,0,0,0.001,-0.003,0; Charging Saturation Voltage: 4.24V; Type of Battery: 锂离子; Number of Cells: 1; Device: TP4057; LCSC Part Name: TP4057; SupplierPart: C725791; ManufacturerPart: TP4057; Supplier Footprint: SOT-23-6; JLCPCB Part Class: 扩展库; Datasheet: https://item.szlcsc.com/datasheet/TP4057/772194.html; Supplier: LCSC; ConvertToPcb: yes; FootprintName: SOT-23-6_L2.9-W1.6-P0.95-LS2.8-BR; The Chip Type: -; Voltage - Supply: 4V~6.5V; Charge Current - Max: -; Operating Temperature: -40℃~+85℃
USB1 = TYPE-C 16PIN 2MD(073): 连接器类型:Type-C;协议标准:USB 3.1;公母:母;安装方式:卧贴;触点数量:16P;端口数量:1;额定电流 - 电源:3A;工作温度:-25℃~+85℃;; Manufacturer: SHOU HAN(首韩); Symbol: TYPEC-302-BRP16SC16; Convert to PCB: yes; ModelId: 3a41b9ec9b654a0fad4d118405ec6290; ModelTransform: 351.9678,298.4246,0,0,0,0,0,-47.244,-35.433; Protocol Standard: USB 3.1; Gender: 母; Number of Contacts: 16P; Number of Ports: 1; Current Rating-Power: 3A; Voltage Rating: 5V; Connect-Disconnect Life: 5千次; Detection color: 黑色; Device: TYPE-C 16PIN 2MD(073); Supplier: LCSC; Supplier Part: C2765186; Manufacturer Part: TYPE-C 16PIN 2MD(073); Add into BOM: yes; LCSC Part Name: Type-C 母 卧贴; Supplier Footprint: SMD; JLCPCB Part Class: Extended Part; Datasheet: https://atta.szlcsc.com/upload/public/pdf/source/20250506/FFB74EDFDFA0AC372CE4A8E4F739CCEF.pdf; FootprintName: USB-C-SMD_TYPE-C-6PIN-2MD-073; ModelName: USB-C-SMD_TYPE-C-6PIN-2MD-073; Connector Type: Type-C; Mounting Type: 卧贴; Supplementary Features: -; Center Height: -; Length: -; Operating Temperature: -25℃~+85℃
X1 = TXM12M0004252FBCEO00T: 晶振类型:贴片晶振;频率:12MHz;常温频差:±10ppm;负载电容:12pF;频率稳定度:±30ppm;; Manufacturer: YJX(雅晶鑫); Convert to PCB: yes; ModelId: 6c59bf18646c482ead3932fe5df36485; ModelName: OSC-SMD_4P-L2.5-W2.0-H0.6; ModelTransform: 98.425,78.74,0,0,0,0,0.0005,0,0; Normal temperature Frequency Tolerance: ±10ppm; Load Capacitance: 12pF; Frequency Stability: ±30ppm; Equivalent Series Resistance(ESR): 120Ω; Device: TXM12M0004252FBCEO00T; Symbol: TXM12M0004252FBCEO00T; Supplier: LCSC; Supplier Part: C284155; Manufacturer Part: TXM12M0004252FBCEO00T; Add into BOM: yes; LCSC Part Name: 12MHz ±10ppm 12pF; Supplier Footprint: SMD2520-4P; JLCPCB Part Class: Extended Part; Datasheet: https://atta.szlcsc.com/upload/public/pdf/source/20180910/C284155_B9AC3CB548367C19CE747B551130DB15.pdf; FootprintName: OSC-SMD_4P-L2.5-W2.0-BL; Type: 贴片晶振; Value: 12MHz; Operating Temperature: -40℃~+85℃